# Altium schematic sheet pca20072_misc.SchDoc: =BoardTitle+' - Misc'
size A4; Organization: Nordic Semiconductor; DocumentNumber: 5; SheetNumber: 5; SheetTotal: 5; CompanyName: Nordic Semiconductor; DocumentSize: A4
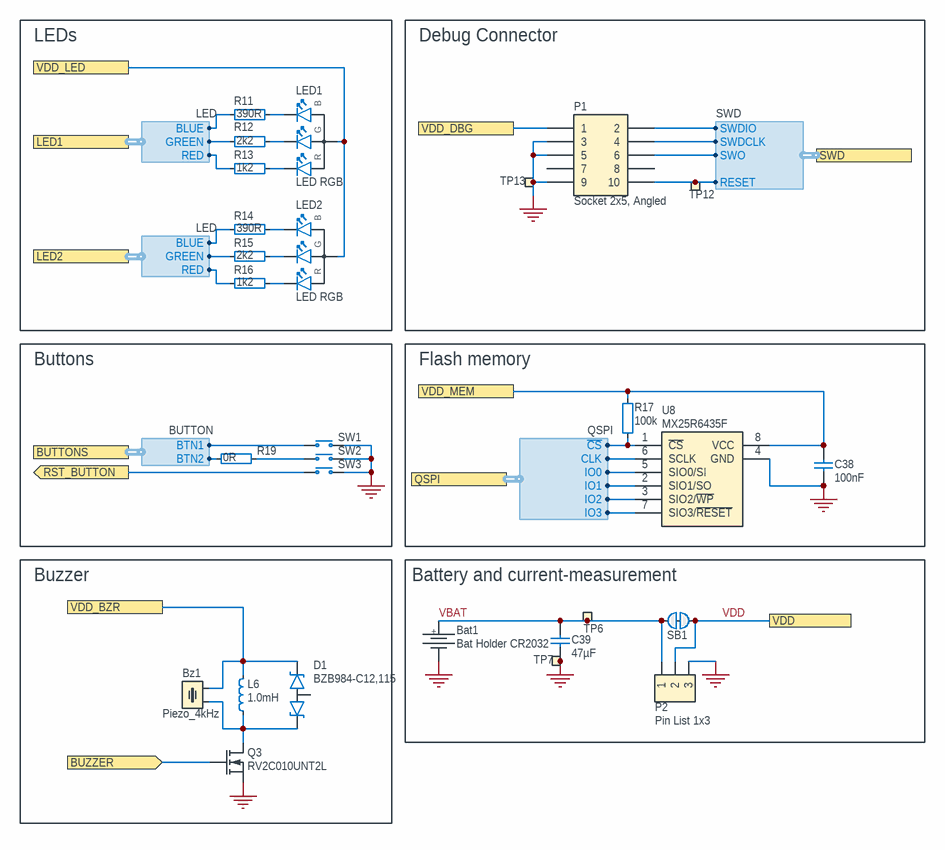
[diagram p0: pca20072_misc.SchDoc]

## Parts
Bat1  Bat Holder CR2032  [L-KLS5-CR2032-23-B1]
Bz1  Piezo_4kHz  [Buzzer_PKMCS0909]
C38  100nF  [CAPC0603X03L_C]
C39  47µF  [CAPC1608X06L]
D1  BZB984-C12,115  [SOTFL50P160X60-3L]
L6  1.0mH  [INDC2520X10N]
LED1  LED RGB  [LED_RGB_0603]
LED2  LED RGB  [LED_RGB_0603]
P1  Socket 2x5, Angled  [SOCKET_ANG_2x5_TH-1.27mm]
P2  Pin List 1x3  [LIST_1x3-NC]
Q3  RV2C010UNT2L  [DFN65P100X40-3L]
R11  390R  [RESC0603X03L_C]
R12  2k2  [RESC0603X03L_C]
R13  1k2  [RESC0603X03L_C]
R14  390R  [RESC0603X03L_C]
R15  2k2  [RESC0603X03L_C]
R16  1k2  [RESC0603X03L_C]
R17  100k  [RESC0603X03L_C]
R19  0R  [RESC0603X03L_C]
SB1  Solderbridge  [Solderbridge_Shorted_Power]  (value not drawn)  (net tie, no BOM)
SW1  PB SW  [KLS-TS3402]  (value not drawn)
SW2  PB SW  [SW_TACTILE_2.6x3.0MM_4-LEAD]  (value not drawn)
SW3  PB SW  [SW_TACTILE_2.6x3.0MM_4-LEAD]  (value not drawn)
TP6  Ø1.5mm,SMD  [TP_SMD_D1.5mm]  (value not drawn)  (no BOM)
TP7  Ø1.5mm,SMD  [TP_SMD_D1.5mm]  (value not drawn)  (no BOM)
TP12  Ø1.0mm,SMD  [TP_SMD_D1.0mm]  (value not drawn)  (no BOM)
TP13  Ø1.0mm,SMD  [TP_SMD_D1.0mm]  (value not drawn)  (no BOM)
U8  MX25R6435F  [SON80P300X60_HS-9N]

## Blocks framed on the sheet
LEDs: LED1 LED2 R11-R16
Debug Connector: P1 TP12 TP13
Buttons: R19 SW1-SW3
Flash memory: C38 R17 U8
Buzzer: Bz1 D1 L6 Q3
Battery and current-measurement: Bat1 C39 P2 SB1 TP6 TP7

## Ports
BUTTONS (harness BUTTON), BUZZER (in), LED1 (harness LED), LED2 (harness LED), QSPI (harness QSPI), RST_BUTTON (out), SWD (harness SWD), VDD, VDD_BZR, VDD_DBG, VDD_LED, VDD_MEM

## Harnesses
QSPI: ~{CS}, IO0, CLK, IO1, IO2, IO3
LED: GREEN, RED, BLUE
SWD: SWDIO, SWDCLK, SWO, RESET
BUTTON: BTN2, BTN1

## Nets
GND: Bat1.2 C38.2 C39.1 P1.3 P1.5 P1.9 P2.3 Q3.2(S) SW1.1(N.O) SW2.2(COM) SW3.1(N.O) TP7.1 TP13.1 U8.4(GND) U8.9(GND)
BUZZER: Q3.1(G) ; port BUZZER
RST_BUTTON: SW3.2(COM) ; port RST_BUTTON
VBAT: Bat1.1 C39.2 P2.1 SB1.1 TP6.1
VDD: P2.2 SB1.2 ; port VDD
VDD_BZR: Bz1.1 D1.1(K1) L6.2 ; port VDD_BZR
VDD_DBG: P1.1 ; port VDD_DBG
VDD_LED: LED1.4(A) LED2.4(A) ; port VDD_LED
VDD_MEM: C38.1 R17.2 U8.8(VCC) ; port VDD_MEM
NetBz1_2: Bz1.2 D1.2(K2) L6.1 Q3.3(D)
NetLED1_1: LED1.1(C_RED) R13.2
NetLED1_2: LED1.2(C_GREEN) R12.2
NetLED1_3: LED1.3(C_BLUE) R11.2
NetLED2_1: LED2.1(C_RED) R16.2
NetLED2_2: LED2.2(C_GREEN) R15.2
NetLED2_3: LED2.3(C_BLUE) R14.2
NetP1_2: P1.2 ; port SWD.SWDIO
NetP1_4: P1.4 ; port SWD.SWDCLK
NetP1_6: P1.6 ; port SWD.SWO
NetP1_10: P1.10 TP12.1 ; port SWD.RESET
NetR11_1: R11.1 ; port LED1.BLUE
NetR12_1: R12.1 ; port LED1.GREEN
NetR13_1: R13.1 ; port LED1.RED
NetR14_1: R14.1 ; port LED2.BLUE
NetR15_1: R15.1 ; port LED2.GREEN
NetR16_1: R16.1 ; port LED2.RED
NetR17_1: R17.1 U8.1(~{CS}) ; port QSPI.~{CS}
NetR19_1: R19.1 SW2.1(N.O)
NetR19_2: R19.2 ; port BUTTONS.BTN2
NetSW1_2: SW1.2(COM) ; port BUTTONS.BTN1
NetU8_2: U8.2(SIO1/SO) ; port QSPI.IO1
NetU8_3: U8.3(SIO2/~{WP}) ; port QSPI.IO2
NetU8_5: U8.5(SIO0/SI) ; port QSPI.IO0
NetU8_6: U8.6(SCLK) ; port QSPI.CLK
NetU8_7: U8.7(SIO3/~{RESET}) ; port QSPI.IO3

Not connected (* = marked no-connect by the designer): D1 3(CA); P1 7 8

## Notes on the sheet
- Title
- Size
- Date:
- File:
- A4
- PCB Assembly Number
- Sheet
- Drawn By:
- Revision
- of
- Classification:
- (in symbol APHF1608LSEEQBDZGKC) B; G; R
- (in symbol Bat Holder L-KLS5-CR2032-23-BR) +

## Library data of the parts
Bat1 = Bat Holder L-KLS5-CR2032-23-BR: Bat Holder CR2032 SMD; Manufacturer: KLS Electronic; Part number NEMS: 100500651; Component Status: Active; Pad Count: 2; Artikkelnr Noca: N.A.; System: Connector; Part Number: Bat Holder L-KLS5-CR2032-23-BR; PartId: 100500651; Component Class: Connectors; Author: rsk; Manufacturer Part Number: L-KLS5-CR2032-23-BR; ComponentLink1URL: http://www.klsele.com/admin/product_upload/20151124103736KLS5-CR2032-23-B.pdf; ComponentLink1Description: Datasheet; ComponentLink2URL: N.A.; ComponentLink2Description: Supplier link; HelpURL: http://www.klsele.com/products/connectors/Coin-Cell-Holders-Series/4685.html; LatestRevisionDate: 2025-09-19; Published: 2019-08-28; Footprint Doc: CR2032_HOLDER; Value: Bat Holder CR2032; Note: Bat Holder CR2032; Supplier 1: Milexia; Supplier Part Number 1: L-KLS5-CR2032-23-BR; Supplier 2: Mouser; Supplier Part Number 2: 614-SMTU2032-LF; Part number IPS: N.A.; Part number Norautron: N.A.
Bz1 = PKMCS0909E4000-R1: Piezo Buzzer, SMD, 9.0mm x 9.0mm x 1.9mm, 4kHz, 65dB @ 1.5V, <12.5Vp-p; Manufacturer: Murata; Part number NEMS: 101000026; Component Status: Active; Pad Count: 2; Note: 1.5 ~ 12.5V; Artikkelnr Noca: N.A.; Part Number: PKMCS0909E4000-R1; PartId: 101000026; Component Class: Transducers; Author: rsk; Manufacturer Part Number: PKMCS0909E4000-R1; ComponentLink1URL: N.A.; ComponentLink1Description: Datasheet; ComponentLink2URL: N.A.; ComponentLink2Description: Supplier link; HelpURL: https://www.murata.com/en-global/products/productdetail.aspx?partno=PKMCS0909E4000-R1; LatestRevisionDate: 2020-08-04; Published: 2020-08-04; Footprint Doc: Buzzer_PKMCS0909; Value: Piezo_4kHz; Supplier 1: DigiKey; Supplier Part Number 1: 490-9647-1-ND; Supplier 2: Mouser; Supplier Part Number 2: 81-PKMCS0909E4000-R1; Part number IPS: N.A.; Part number Norautron: N.A.
C38 = C0201-100n: Capacitor, X5R, ±10%, 100nF, 16V; Manufacturer: N.A.; Part number IPS: 00000001248, 00000002505; Part number Norautron: 262071862; Part number NEMS: 100200078; Pad Count: 2; Component Status: Active; Part Number: C0201-100n; Value: 100nF; Footprint Doc: 0201; Component Class: Capacitors; Author: rsk; PartId: 100200078; Manufacturer Part Number: N.A.; ComponentLink1URL: N.A.; ComponentLink1Description: Datasheet; ComponentLink2URL: N.A.; ComponentLink2Description: Supplier link; HelpURL: N.A.; LatestRevisionDate: 2024-06-27; Published: 2014-11-13; Note: 16V; Supplier 1: N.A.; Supplier Part Number 1: N.A.; Supplier 2: N.A.; Supplier Part Number 2: N.A.; Artikkelnr Noca: N.A.
C39 = C0603-47µ: Capacitor, X5R, ±20%, 6.3V; Manufacturer: N.A.; Part number IPS: 00000001818; Part number NEMS: 100200277; Component Status: Active; Pad Count: 2; Part Number: C0603-47µ; PartId: 100200277; Component Class: Capacitors; Author: rsk; Manufacturer Part Number: N.A.; ComponentLink1URL: N.A.; ComponentLink1Description: Datasheet; ComponentLink2URL: N.A.; ComponentLink2Description: Supplier link; HelpURL: N.A.; LatestRevisionDate: 2020-04-28; Published: 2016-04-16; Footprint Doc: 0603; Value: 47µF; Note: 6.3V; Supplier 1: N.A.; Supplier Part Number 1: N.A.; Supplier 2: N.A.; Supplier Part Number 2: N.A.; Artikkelnr Noca: N.A.; Part number Norautron: N.A.
D1 = BZB984-C12,115: Zener Diode Array, 1 Pair, Common Anode, 12V, 265mW, ±5%; Manufacturer: Nexperia; Part number NEMS: 101300214; Component Status: Active; Pad Count: 3; Note: N.A.; Part Number: BZB984-C12,115; Component Class: Semiconductors; Author: rubr; Manufacturer Part Number: BZB984-C12,115; ComponentLink1URL: https://assets.nexperia.com/documents/data-sheet/BZB984_SER.pdf; ComponentLink1Description: Datasheet; ComponentLink2URL: https://www.digikey.com/en/products/detail/nexperia-usa-inc/BZB984-C12-115/1155439; ComponentLink2Description: Supplier link; HelpURL: https://www.nexperia.com/product/BZB984-C12; LatestRevisionDate: 2025-01-30; Published: 2025-01-30; Footprint Doc: SOT-663; Value: BZB984-C12,115; Supplier 1: DigiKey; Supplier Part Number 1: 1727-1585-1-ND; Supplier 2: N.A.; Supplier Part Number 2: N.A.; Artikkelnr Noca: N.A.; Part number IPS: N.A.; Part number Norautron: N.A.; PartId: 101300214
L6 = L1008-1m0-15mA-24Ω-LSQBA251818T102K: Inductor, 15mA, ±10%, 24Ω; Manufacturer: Taiyo Yuden; Part number NEMS: 100300509; Component Status: Active; Pad Count: 2; Note: -40°C ~ 105°C; Artikkelnr Noca: N.A.; Part Number: L1008-1m0-15mA-24Ω-LSQBA251818T102K; Component Class: Inductors; Author: rubr; Manufacturer Part Number: LSQBA251818T102K; ComponentLink1URL: https://ds.yuden.co.jp/TYCOMPAS/or/specSheet?pn=LSQBA251818T102K; ComponentLink1Description: Datasheet; ComponentLink2URL: https://www.digikey.com/en/products/detail/taiyo-yuden/LSQBA251818T102K/16661924; ComponentLink2Description: Supplier link; HelpURL: https://ds.yuden.co.jp/TYCOMPAS/or/detail?pn=LSQBA251818T102K&u=M; LatestRevisionDate: 2025-01-30; Published: 2025-01-30; Footprint Doc: 1008; Value: 1.0mH; Supplier 1: DigiKey; Supplier Part Number 1: 587-LSQBA251818T102KCT-ND; Supplier 2: N.A.; Supplier Part Number 2: N.A.; Part number IPS: N.A.; Part number Norautron: N.A.; PartId: 100300509
LED1 LED2 = APHF1608LSEEQBDZGKC: RGB LED 1.60 mm x 0.80 mm SMD; Manufacturer: Kingbright Company LLC; Part number IPS: 00000001254; Part number Norautron: 26470023; Part number NEMS: 101400123; Note: N.A.; Pad Count: 4; Component Status: Active; Part Number: APHF1608LSEEQBDZGKC; Manufacturer Part Number: APHF1608LSEEQBDZGKC; LatestRevisionDate: 2017-11-09; Published: 2017-09-18; Value: LED RGB; Artikkelnr Noca: N.A.; Footprint Doc: LED_RGB_0603; ComponentLink1Description: Datasheet; ComponentLink1URL: N.A.; ComponentLink2Description: Supplier link; ComponentLink2URL: N.A.; HelpURL: http://www.kingbrightusa.com/images/catalog/SPEC/APHF1608LSEEQBDZGKC.pdf; Supplier 1: DigiKey; Supplier Part Number 1: 754-2143-1-ND; Supplier 2: N.A.; Supplier Part Number 2: N.A.; PartId: 101400123; Component Class: Optoelectronics; Author: rsk
P1 = Socket 2x5, 1.27mm, Right Angle, TH: Socket 2x5, 1.27mm (50mil), Right Angle, TH; Manufacturer: WCON; Manufacturer Part Number: 2344-205RS0CUNR3; Part number NEMS: 100500894; Note: (Replaced 2344-205RS0CUNR1); Artikkelnr Noca: N.A.; Pad Count: 10; Component Status: Active; System: Connector; Part Number: Socket 2x5, 1.27mm, Right Angle, TH; Footprint Doc: SOCKET_ANG_2x5_TH-1.27mm; LatestRevisionDate: 2025-01-30; Published: 2025-01-30; Value: Socket 2x5, Angled; Part number IPS: N.A.; ComponentLink1URL: https://www.wcon.com/assets/upload/2023-09-09/C_2344-2XXRXXCUNT1.pdf; ComponentLink1Description: Datasheet; ComponentLink2URL: N.A.; ComponentLink2Description: Supplier link; HelpURL: https://www.wcon.com/product/2344-2xxrxxcunx1.html; Supplier 1: Milexia; Supplier Part Number 1: 2344-205RS0CUNR3; Supplier 2: N.A.; Supplier Part Number 2: N.A.; Component Class: Connectors; Author: rubr; Part number Norautron: N.A.; PartId: 100500894
P2 = Pin List 1x3, N.C.: Pin List 1x3, 2.54mm (100mil); Manufacturer: N.A.; Part number NEMS: 100500305; Component Status: Active; Pad Count: 3; Assembly: Not mounted; System: Connector; Part Number: Pin List 1x3, N.C.; PartId: 100500305; Component Class: Connectors; Author: rsk; Manufacturer Part Number: N.A.; ComponentLink1URL: N.A.; ComponentLink1Description: Datasheet; ComponentLink2URL: N.A.; ComponentLink2Description: Supplier link; HelpURL: N.A.; LatestRevisionDate: 2017-09-07; Published: 2017-09-07; Footprint Doc: LIST_1x3; Value: Pin List 1x3; Note: N.A.; Supplier 1: N.A.; Supplier Part Number 1: N.A.; Supplier 2: N.A.; Supplier Part Number 2: N.A.; Artikkelnr Noca: N.A.; Part number IPS: N.A.; Part number Norautron: N.A.
Q3 = RV2C010UNT2L: N-Channel MOSFET, 20V, 1A, 470mOhm, 400mW, -55°C ~ 150°C; Manufacturer: Rohm Semiconductor; Part number IPS: 00000009976; Part number Norautron: 26320026; Part number NEMS: 101300132; Component Status: Active; Pad Count: 3; Note: N.A.; Artikkelnr Noca: 35010020; Part Number: RV2C010UNT2L; PartId: 101300132; Component Class: Semiconductors; Author: rsk; Manufacturer Part Number: RV2C010UNT2L; ComponentLink1URL: N.A.; ComponentLink1Description: Datasheet; ComponentLink2URL: N.A.; ComponentLink2Description: Supplier link; HelpURL: http://rohmfs.rohm.com/en/products/databook/datasheet/discrete/transistor/mosfet/rv2c010unt2l-e.pdf; LatestRevisionDate: 2024-09-18; Published: 2016-08-09; Footprint Doc: DFN-3; Value: RV2C010UNT2L; Supplier 1: DigiKey; Supplier Part Number 1: RV2C010UNT2LCT-ND; Supplier 2: Mouser; Supplier Part Number 2: 755-RV2C010UNT2L
R11 R14 = R0201-390: Resistor, ±1%, 0.05W; Manufacturer: N.A.; Part number IPS: 00000001258; Part number Norautron: 26470031; Part number NEMS: 100100035; Note: Chip Res 1%; Pad Count: 2; Component Status: Active; Part Number: R0201-390; Manufacturer Part Number: N.A.; ComponentLink1URL: N.A.; ComponentLink1Description: Datasheet; ComponentLink2URL: N.A.; ComponentLink2Description: Supplier link; HelpURL: N.A.; Footprint Doc: 0201; LatestRevisionDate: 2014-11-13; Published: 2014-11-13; Value: 390R; Supplier 1: N.A.; Supplier Part Number 1: N.A.; Supplier 2: N.A.; Supplier Part Number 2: N.A.; Artikkelnr Noca: N.A.; PartId: 100100035; Component Class: Resistors; Author: rsk
R12 R15 = R0201-2k2: Resistor, ±1%, 0.05W; Manufacturer: N.A.; Part number IPS: 00000001257; Part number Norautron: 26470030; Part number NEMS: 100100052; Note: Chip Res 1%; Pad Count: 2; Component Status: Active; Part Number: R0201-2k2; Manufacturer Part Number: N.A.; ComponentLink1URL: N.A.; ComponentLink1Description: Datasheet; ComponentLink2URL: N.A.; ComponentLink2Description: Supplier link; HelpURL: N.A.; Footprint Doc: 0201; LatestRevisionDate: 2014-11-13; Published: 2014-11-13; Value: 2k2; Supplier 1: N.A.; Supplier Part Number 1: N.A.; Supplier 2: N.A.; Supplier Part Number 2: N.A.; Artikkelnr Noca: N.A.; PartId: 100100052; Component Class: Resistors; Author: rsk
R13 R16 = R0201-1k2: Resistor, ±1%, 0.05W; Manufacturer: N.A.; Part number IPS: 00000001256; Part number Norautron: 26107084; Part number NEMS: 100100045; Note: Chip Res 1%; Pad Count: 2; Component Status: Active; Part Number: R0201-1k2; Manufacturer Part Number: N.A.; ComponentLink1URL: N.A.; ComponentLink1Description: Datasheet; ComponentLink2URL: N.A.; ComponentLink2Description: Supplier link; HelpURL: N.A.; Footprint Doc: 0201; LatestRevisionDate: 2014-11-13; Published: 2014-11-13; Value: 1k2; Supplier 1: N.A.; Supplier Part Number 1: N.A.; Supplier 2: N.A.; Supplier Part Number 2: N.A.; Artikkelnr Noca: N.A.; PartId: 100100045; Component Class: Resistors; Author: rsk
R17 = R0201-100k: Resistor, ±1%, 0.05W; Manufacturer: N.A.; Part number IPS: 00000001419; Part number Norautron: 26108487; Part number NEMS: 100100080; Note: Chip Res 1%; Pad Count: 2; Component Status: Active; Part Number: R0201-100k; Manufacturer Part Number: N.A.; Footprint Doc: 0201; LatestRevisionDate: 2014-11-13; Published: 2014-11-13; Value: 100k; Artikkelnr Noca: N.A.; ComponentLink1URL: N.A.; ComponentLink1Description: Datasheet; ComponentLink2URL: N.A.; ComponentLink2Description: Supplier link; HelpURL: N.A.; Supplier 1: N.A.; Supplier Part Number 1: N.A.; Supplier 2: N.A.; Supplier Part Number 2: N.A.; Component Class: Resistors; PartId: 100100080; Author: rsk
R19 = R0201-0R: Resistor, ±5%, 0.05W; Manufacturer: N.A.; Part number IPS: 00000003245; Part number NEMS: 100100001; Note: Chip Res 5%; Pad Count: 2; Component Status: Active; Part Number: R0201-0R; Manufacturer Part Number: N.A.; Footprint Doc: 0201; LatestRevisionDate: 2017-11-09; Published: 2014-11-13; Value: 0R; Artikkelnr Noca: N.A.; ComponentLink1URL: N.A.; ComponentLink1Description: Datasheet; ComponentLink2URL: N.A.; ComponentLink2Description: Supplier link; HelpURL: N.A.; Supplier 1: N.A.; Supplier Part Number 1: N.A.; Supplier 2: N.A.; Supplier Part Number 2: N.A.; Component Class: Resistors; PartId: 100100001; Author: rsk; Part number Norautron: N.A.
SB1 = Solderbridge Shorted Power: Shorted Solderbridge Power; Manufacturer: N.A.; Part number NEMS: 100500460; Pad Count: 2; Component Status: Active; System: Connector; Part Number: Solderbridge Shorted Power; PartId: 100500460; Component Class: Connectors; Author: rsk; Manufacturer Part Number: N.A.; ComponentLink1URL: N.A.; ComponentLink1Description: Datasheet; ComponentLink2URL: N.A.; ComponentLink2Description: Supplier link; HelpURL: N.A.; Footprint Doc: Solderbridge_Shorted_Power; LatestRevisionDate: 2012-08-07; Published: 2012-08-07; Value: Solderbridge; Note: N.A.; Supplier 1: N.A.; Supplier Part Number 1: N.A.; Supplier 2: N.A.; Supplier Part Number 2: N.A.; Artikkelnr Noca: N.A.; Part number IPS: N.A.; Part number Norautron: N.A.
SW1 = L-KLS7-TS3402-2.5-250-B-T: Tactile Switch, SPNO, SMD, 260gf, 4.2x3.3x2.5mm; Manufacturer: KLS Electronic; Part number NEMS: 101500152; Note: N.A.; Pad Count: 4; Component Status: Active; Part Number: L-KLS7-TS3402-2.5-250-B-T; Manufacturer Part Number: L-KLS7-TS3402-2.5-250-B-T; LatestRevisionDate: 2026-02-09; Published: 2025-01-23; Value: PB SW; Artikkelnr Noca: N.A.; Footprint Doc: KLS-TS3402; Part number IPS: N.A.; ComponentLink1Description: Datasheet; ComponentLink1URL: https://img.klsele.com/admin/product_upload/20220406093556L-KLS7-TS3402.pdf; ComponentLink2Description: Supplier link; ComponentLink2URL: N.A.; HelpURL: https://www.klsele.com/products/Switches/Tactile-switches/4201.html; Supplier 1: Milexia; Supplier Part Number 1: L-KLS7-TS3402-2.5-250-B-T; Supplier 2: N.A.; Supplier Part Number 2: N.A.; PartId: 101500152; Component Class: Switches; Author: rubr; Part number Norautron: N.A.
SW2 SW3 = KMT021 NGJ LHS: Nano-Miniature Top Actuated Tact Switch with extended life 3.0x2.6mm; Manufacturer: C&K; Part number IPS: 00000005416; Part number NEMS: 101500039; Note: N.A.; Pad Count: 4; Component Status: Active; Part Number: KMT021 NGJ LHS; Manufacturer Part Number: KMT021 NGJ LHS; Footprint Doc: SW_TACTILE_2.6x3.0MM_4-LEAD; LatestRevisionDate: 2013-08-12; Published: 2013-08-12; Value: PB SW; Artikkelnr Noca: N.A.; ComponentLink1URL: N.A.; ComponentLink1Description: Datasheet; ComponentLink2URL: N.A.; ComponentLink2Description: Supplier link; HelpURL: http://media.digikey.com/pdf/Data%20Sheets/C&K/KMT_0xx_NGJ_LHS_Drawing.pdf; Supplier 1: DigiKey; Supplier Part Number 1: CKN10289CT-ND; Supplier 2: Farnell; Supplier Part Number 2: 190-8260; Component Class: Switches; PartId: 101500039; Author: rsk; Part number Norautron: N.A.
TP6 TP7 = TP_SMD_Ø1.5MM: 1.5mm circular SMD testpad; Manufacturer: Nordic Semiconductor; Manufacturer Part Number: N.A.; Part number NEMS: 100500477; Component Status: Active; Pad Count: 1; Part Number: TP_SMD_Ø1.5MM; PartId: 100500477; Component Class: Connectors; Author: rsk; ComponentLink1URL: N.A.; ComponentLink1Description: Datasheet; ComponentLink2URL: N.A.; ComponentLink2Description: Supplier link; HelpURL: N.A.; LatestRevisionDate: 2021-03-05; Published: 2016-06-02; Footprint Doc: TP_SMD_Ø1.5mm; Value: Ø1.5mm,SMD; Note: N.A.; Supplier 1: N.A.; Supplier Part Number 1: N.A.; Supplier 2: N.A.; Supplier Part Number 2: N.A.; Artikkelnr Noca: N.A.; Part number IPS: N.A.; Part number Norautron: N.A.
TP12 TP13 = TP_SMD_Ø1.0MM: 1.0mm circular SMD testpad; Manufacturer: Nordic Semiconductor; Manufacturer Part Number: N.A.; Part number NEMS: 100500475; Component Status: Active; Pad Count: 1; Part Number: TP_SMD_Ø1.0MM; PartId: 100500475; Component Class: Connectors; Author: rsk; ComponentLink1URL: N.A.; ComponentLink1Description: Datasheet; ComponentLink2URL: N.A.; ComponentLink2Description: Supplier link; HelpURL: N.A.; LatestRevisionDate: 2021-03-05; Published: 2013-06-11; Footprint Doc: TP_SMD_Ø1.0mm; Value: Ø1.0mm,SMD; Note: N.A.; Supplier 1: N.A.; Supplier Part Number 1: N.A.; Supplier 2: N.A.; Supplier Part Number 2: N.A.; Artikkelnr Noca: N.A.; Part number IPS: N.A.; Part number Norautron: N.A.
U8 = MX25R6435FZBIH3: Ultra low power, 64M-bit, serial multi I/O flash memory; Manufacturer: Macronix; Part number NEMS: 101900860; Note: N.A.; Pad Count: 8; Component Status: Active; Part Number: MX25R6435FZBIH3; Manufacturer Part Number: MX25R6435FZBIH3; Footprint Doc: USON-8; LatestRevisionDate: 2025-02-11; Published: 2025-02-11; Value: MX25R6435F; Artikkelnr Noca: N.A.; Part number IPS: N.A.; ComponentLink1URL: https://www.macronix.com/Lists/Datasheet/Attachments/8868/MX25R6435F,%20Wide%20Range,%2064Mb,%20v1.6.pdf; ComponentLink1Description: Datasheet; ComponentLink2URL: https://www.digikey.com/en/products/detail/macronix/MX25R6435FZBIH3/21700503; ComponentLink2Description: Supplier link; HelpURL: https://www.macronix.com/en-us/products/NOR-Flash/Serial-NOR-Flash/Pages/spec.aspx?p=MX25R6435F&m=Serial%20NOR%20Flash&n=PM2138&epn=MX25R6435FZBIH3; Supplier 1: DigiKey; Supplier Part Number 1: 1092-MX25R6435FZBIH3CT-ND; Supplier 2: N.A.; Supplier Part Number 2: N.A.; Component Class: Misc_ICs; PartId: 101900860; Author: rubr; Part number Norautron: N.A.